# Altium project OBKJECT_DETECTOR.PrjPcb
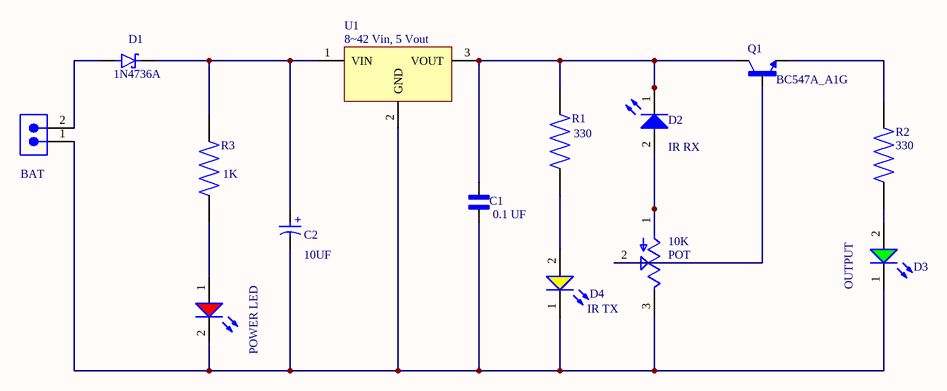
[diagram p0: Sheet1.SchDoc]
1 sheet, 14 parts. Net scope: global (net labels, ports and power ports of the same name join across sheets).
Board file: PCB1OBJECTDETECTOR.PcbDoc

## Sheet Sheet1.SchDoc
size A4; SheetNumber: 1; SheetTotal: 1; SPICEModelCacheOYBHKFRB: <root> / <DocumentId>OYBHKFRB</DocumentId> / <CacheFrame Number="0"> / <Model Name="5mm_151051rs11000" Kind="CKT"> / <Text>****** / .subckt 5mm_151051RS11000  1  2 / D1 1 2 TMRC / .MODEL TMRC D / + IS=10.010E-21 / + N=1.9769 / + RS=1.0000E-6 / + IKF=1.0000E3 / + CJO=1.0000E-12 / + M=.3333 / + VJ=.75 / + BV=5 / + IBV=10.00E-6 / + TT=5.0000E-9 / .ends</Text> / </Model> / <Model Name="5mm_151053ys04500" Kind="CKT"> / <Text>****** / .subckt 5mm_151053YS04500  1  2 / D1 1 2 TMRW / .MODEL TMRW D / + IS=1.9466E-15 / + N=2.3301 / + RS=.86225 / + IKF=202.15E-6 / + CJO=1.0000E-12 / + M=.3333 / + VJ=.75 / + BV=5 / + IBV=50.00E-6 / + TT=5.0000E-9 / .ends</Text> / </Model> / <Model Name="860010672001_100nf" Kind="CKT"> / <Text>******* / .subckt 860010672001_100nF 1 2 / Rser 1 3 3.09403328355 / Lser 2 4 3.756071489E-09 / C1 3 4 0.0000001 / Rpar 3 4 16666666.6666667 / .ends 860010672001_100nF</Text> / </Model> / <Model Name="5mm_151053bs04500" Kind="CKT"> / <Text>****** / .subckt 5mm_151053BS04500  1  2 / D1 1 2 TMRW / .MODEL TMRW D / + IS=68.784E-18 / + N=2.7313 / + RS=.91252 / + IKF=184.29E-6 / + CJO=1.0000E-12 / + M=.3333 / + VJ=.75 / + BV=5 / + IBV=50.00E-6 / + TT=5.0000E-9 / .ends</Text> / </Model> / <Model Name="5mm_151053gs03000" Kind="CKT"> / <Text>****** / .subckt 5mm_151053GS03000  1  2 / D1 1 2 TMRW / .MODEL TMRW D / + IS=419.72E-9 / + N=4.3096 / + RS=7.9084 / + IKF=259.74E-12 / + CJO=1.0000E-12 / + M=.3333 / + VJ=.75 / + BV=5 / + IBV=50.00E-6 / + TT=5.0000E-9 / .ends</Text> / </Model> / </CacheFrame> / </root>

### Parts
10K  POT  [TRIM_3362P-1-102]
BAT  61300211121  [61300211121]  (value not drawn)
C1  0.1 UF  [CAPRB250W50L550T350H600]
C2  0.1uF  [WCAP-ATG8_D5H11]  (value not drawn)
D1  1N4736A  [DIOAD1036W78L463D237]
D2  Blue, 2.7V, 45°  [WL-TMRW_D5.8H11.7]  (value not drawn)
D3  Green, 3.4V, 30°  [WL-TMRW_D5.8H11.7]  (value not drawn)
D4  Yellow, 2.1V, 45°  [WL-TMRW_D5.8H11.7]  (value not drawn)
POWER_LED  Red, 2.1V, 60°  [WL-TMRC_D5.9H8.7]  (value not drawn)
Q1  BC547A_A1G  [TO92250P510H770-3]
R1  330  [RESAD1100W55L680D260]
R2  330  [RESAD1100W55L680D260]
R3  1K  [RESAD1100W55L680D260]
U1  8~42 Vin, 5 Vout  [WPME-FDSM_SIP-3_173010x42]

### Nets
Net10K_1: 10K.1(CCW) D2.2(A)
Net10K_2: 10K.2(WIPER) Q1.2(B)
Net10K_3: 10K.3(CW) BAT.1 C1.1 C2.2(N) D3.1(K) D4.1(K) POWER_LED.2(K) U1.2(GND)
NetBAT_2: BAT.2 D1.2(A)
NetC1_2: C1.2 D2.1(K) Q1.1(C) R1.2 U1.3(VOUT)
NetC2_1: C2.1(P) D1.1(K) R3.2 U1.1(VIN)
NetD3_2: D3.2(A) R2.1
NetD4_2: D4.2(A) R1.1
NetPOWER_LED_1: POWER_LED.1(A) R3.1
NetQ1_3: Q1.3(E) R2.2

### Notes on the sheet
- (near D2) IR RX
- (near C2) 10UF
- (near D3) OUTPUT
- IR TX
- (in symbol 860010672001) +

### Library data of the parts
10K = 3362P-1-102: TRIMMER - 1/4in SQ ST CERMET | Bourns 3362P-1-102; SnapEDA_Link: https://www.snapeda.com/parts/3362P-1-102/Bourns/view-part/?ref=snap; Package: 3362P-1 Bourns Inc.; Value: *; MF: Bourns; MP: 3362P-1-102; Check_prices: https://www.snapeda.com/parts/3362P-1-102/Bourns/view-part/?ref=eda
BAT = 61300211121: WR-PHD Pin Header, THT, Vertical, pitch 2.54mm, 1 Row, 2P; Manufacturer: Wurth Elektronik; Contact Resistance: 20mOhm; Rated Current: 3A; Working Voltage: 250V; Withstanding Voltage: 500V; Manufacturer Part Number: 61300211121; Category: Board-to-Board Connectors; Match Code: WR-PHD; ComponentLink1Description: Website Link; ComponentLink1URL: https://www.we-online.com/redexpert/article/61300211121?ad; ComponentLink2Description: Datasheet Link; ComponentLink2URL: https://www.we-online.com/redexpert/spec/61300211121?ad; Mount: Through Hole; Operating Temperature Max: 105°C; Operating Temperature Min: -40°C; Packaging: Bag; Gender: Pin Header; Number of Pins: 2; Number of Rows: 1; Orientation: Vertical; Pitch: 2.54mm
C1 = FA16X7R2A224KNU06: 0.22 ÂµF Â±10% 100V Ceramic Capacitor X7R Radial; MF: TDK; SnapEDA_Link: https://www.snapeda.com/parts/FA16X7R2A224KNU06/TDK/view-part/?ref=snap; Package: Radial TDK; Value: *; MP: FA16X7R2A224KNU06; Check_prices: https://www.snapeda.com/parts/FA16X7R2A224KNU06/TDK/view-part/?ref=eda
C2 = 860010672001: WCAP-ATG8 Aluminum Electrolytic Capacitor, Radial, THT, D5 x H11mm, 0.1uF, 50V; Manufacturer: Wurth Elektronik; Capacitance Tolerance: +/-20%; Dissipation Factor: 10%; Endurance: 2000h; Leakage Current: 3uA; Ripple Current: 3.3mA; Technical Reference: ATBC110R10M050DSPA3B000; Manufacturer Part Number: 860010672001; Category: Aluminum Electrolytic Capacitors; Match Code: WCAP-ATG8; ComponentLink1Description: Website Link; ComponentLink1URL: https://www.we-online.com/redexpert/article/860010672001?ad; ComponentLink2Description: Datasheet Link; ComponentLink2URL: https://www.we-online.com/redexpert/spec/860010672001?ad; Mount: Through Hole; Operating Temperature Max: 85°C; Operating Temperature Min: -40°C; Packaging: Ammo Pack; Height: 11mm; Diameter: 5mm; Capacitance: 0.1uF; Rated Voltage (DC): 50V
D1 = 1N4736A: 1N4736 Series 1 W 6.8 V 10 uA Axial Through Hole Zener Diode - DO-41; MF: ON Semiconductor; SnapEDA_Link: https://www.snapeda.com/parts/1N4736A/Onsemi/view-part/?ref=snap; Package: DO-41 Fairchild Semiconductor; Value: *; MP: 1N4736A; Check_prices: https://www.snapeda.com/parts/1N4736A/Onsemi/view-part/?ref=eda
D2 = 151053BS04500: WL-TMRW Mono-color Round Waterclear, THT, D5.8 x H11.7mm, Blue, 2.7V, 45°; Manufacturer: Wurth Elektronik; Chip Technology: InGaN; Dominant Wavelength: 465nm; Luminous Intensity: 2000mcd; Peak Wavelength: 461nm; Manufacturer Part Number: 151053BS04500; Category: Signal LEDs; Match Code: WL-TMRW; ComponentLink1Description: Website Link; ComponentLink1URL: https://www.we-online.com/redexpert/article/151053BS04500?ad; ComponentLink2Description: Datasheet Link; ComponentLink2URL: https://www.we-online.com/redexpert/spec/151053BS04500?ad; Mount: Through Hole; Operating Temperature Max: 85°C; Operating Temperature Min: -40°C; Packaging: Bulk; Height: 11.7mm; Diameter: 5.8mm; Emitting Color: Blue; Forward Voltage: 2.7V; Viewing Angle: 45°
D3 = 151053GS03000: WL-TMRW Mono-color Round Waterclear, THT, D5.8 x H11.7mm, Green, 3.4V, 30°; Manufacturer: Wurth Elektronik; Chip Technology: InGaN; Dominant Wavelength: 522nm; Luminous Intensity: 10000mcd; Peak Wavelength: 515nm; Manufacturer Part Number: 151053GS03000; Category: Signal LEDs; Match Code: WL-TMRW; ComponentLink1Description: Website Link; ComponentLink1URL: https://www.we-online.com/redexpert/article/151053GS03000?ad; ComponentLink2Description: Datasheet Link; ComponentLink2URL: https://www.we-online.com/redexpert/spec/151053GS03000?ad; Mount: Through Hole; Operating Temperature Max: 85°C; Operating Temperature Min: -40°C; Packaging: Bulk; Height: 11.7mm; Diameter: 5.8mm; Emitting Color: Green; Forward Voltage: 3.4V; Viewing Angle: 30°
D4 = 151053YS04500: WL-TMRW Mono-color Round Waterclear, THT, D5.8 x H11.7mm, Yellow, 2.1V, 45°; Manufacturer: Wurth Elektronik; Chip Technology: AlInGaP; Dominant Wavelength: 590nm; Luminous Intensity: 1500mcd; Peak Wavelength: 592nm; Manufacturer Part Number: 151053YS04500; Category: Signal LEDs; Match Code: WL-TMRW; ComponentLink1Description: Website Link; ComponentLink1URL: https://www.we-online.com/redexpert/article/151053YS04500?ad; ComponentLink2Description: Datasheet Link; ComponentLink2URL: https://www.we-online.com/redexpert/spec/151053YS04500?ad; Mount: Through Hole; Operating Temperature Max: 85°C; Operating Temperature Min: -40°C; Packaging: Bulk; Height: 11.7mm; Diameter: 5.8mm; Emitting Color: Yellow; Forward Voltage: 2.1V; Viewing Angle: 45°
POWER_LED = 151051RS11000: WL-TMRC Mono-color Round Color, THT, D5.9 x H8.7mm, Red, 2.1V, 60°; Manufacturer: Wurth Elektronik; Case/Size Code: 5mm; Chip Technology: AlGaInP; Dominant Wavelength: 645nm; Luminous Intensity: 30mcd; Peak Wavelength: 650nm; Manufacturer Part Number: 151051RS11000; Category: Signal LEDs; Match Code: WL-TMRC; ComponentLink1Description: Website Link; ComponentLink1URL: https://www.we-online.com/redexpert/article/151051RS11000?ad; ComponentLink2Description: Datasheet Link; ComponentLink2URL: https://www.we-online.com/redexpert/spec/151051RS11000?ad; Mount: Through Hole; Operating Temperature Max: 85°C; Operating Temperature Min: -40°C; Packaging: Bulk; Height: 8.7mm; Diameter: 5.9mm; Emitting Color: Red; Forward Voltage: 2.1V; Viewing Angle: 60°
Q1 = BC547A_A1G: TO-92, 50V, 0.1A, NPN Bipolar Transistor; MF: Taiwan Semiconductor Corporation; MP: BC547A A1G; Availability: In Stock; SnapEDA_Link: https://www.snapeda.com/parts/BC547A%20A1G/Taiwan+Semiconductor/view-part/?ref=snap; Purchase-URL: https://pricing.snapeda.com/search/part/BC547A A1G/?ref=eda; Price: None; Check_prices: https://www.snapeda.com/parts/BC547A%20A1G/Taiwan+Semiconductor/view-part/?ref=eda; Package: TO-92 Taiwan Semiconductor; Value: *
R1-R3 = MFR-25FBF52-1K: 1.07 kOhms Â±1% 0.25W, 1/4W Through Hole Resistor Axial - Metal Film; MF: Yageo; SnapEDA_Link: https://www.snapeda.com/parts/MFR-25FBF52-1K/Yageo/view-part/?ref=snap; Package: RADIAL-2 YAGEO; Value: *; MP: MFR-25FBF52-1K; Check_prices: https://www.snapeda.com/parts/MFR-25FBF52-1K/Yageo/view-part/?ref=eda
U1 = 173010542: WPME-FDSM Fixed Step Down Regulator Module, THT, SIP-3, 8~42 Vin, 5 Vout; Manufacturer: Wurth Elektronik; Input Voltage Min: 8V; Input Voltage Max: 42V; Output Current: 1A; Output Voltage: 5V; Manufacturer Part Number: 173010542; Category: Step Down Converter; Match Code: WPME-FDSM; ComponentLink1Description: Website Link; ComponentLink1URL: https://www.we-online.com/redexpert/article/173010542?ad; ComponentLink2Description: Datasheet Link; ComponentLink2URL: https://www.we-online.com/redexpert/spec/173010542?ad; Mount: Through Hole; Min Operating Temperature: -40°C; Max Operating Temperature: 85°C; Packaging: Tube; Case/Size Code: SIP-3; Length: 11.6mm; Width: 8.5mm; Height: 10.5mm